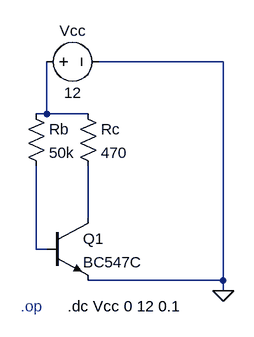
[diagram p0: schematic BJT.asc]
BJT.asc, the LTspice schematic file:
Version 4.1
SHEET 1 880 680
WIRE 432 0 240 0
WIRE 160 80 160 0
WIRE 160 80 144 80
WIRE 224 80 160 80
WIRE 224 240 224 160
WIRE 144 288 144 160
WIRE 160 288 144 288
WIRE 432 336 432 0
WIRE 432 336 224 336
WIRE 432 352 432 336
FLAG 432 352 0
SYMBOL res 128 64 R0
SYMATTR InstName Rb
SYMATTR Value 50k
SYMBOL res 208 64 R0
SYMATTR InstName Rc
SYMATTR Value 470
SYMBOL voltage 144 0 R270
WINDOW 0 32 56 VTop 2
WINDOW 3 -32 56 VBottom 2
WINDOW 123 0 0 Left 0
WINDOW 39 0 0 Left 0
SYMATTR InstName Vcc
SYMATTR Value 12
SYMBOL npn 160 240 R0
SYMATTR InstName Q1
SYMATTR Value BC547C
TEXT 120 376 Left 2 ;.op
TEXT 192 376 Left 2 !.dc Vcc 0 12 0.1

The netlist it stands for:
* BJT.asc
Rb N001 N003 50k
Rc N001 N002 470
Vcc N001 0 12
Q1 N002 N003 0 0 BC547C
.model NPN NPN
.model PNP PNP
.lib standard.bjt
* .op
.dc Vcc 0 12 0.1
.backanno
.end